# Altium project Vibration_Datalogger.PrjPcb (part 6 of 7)
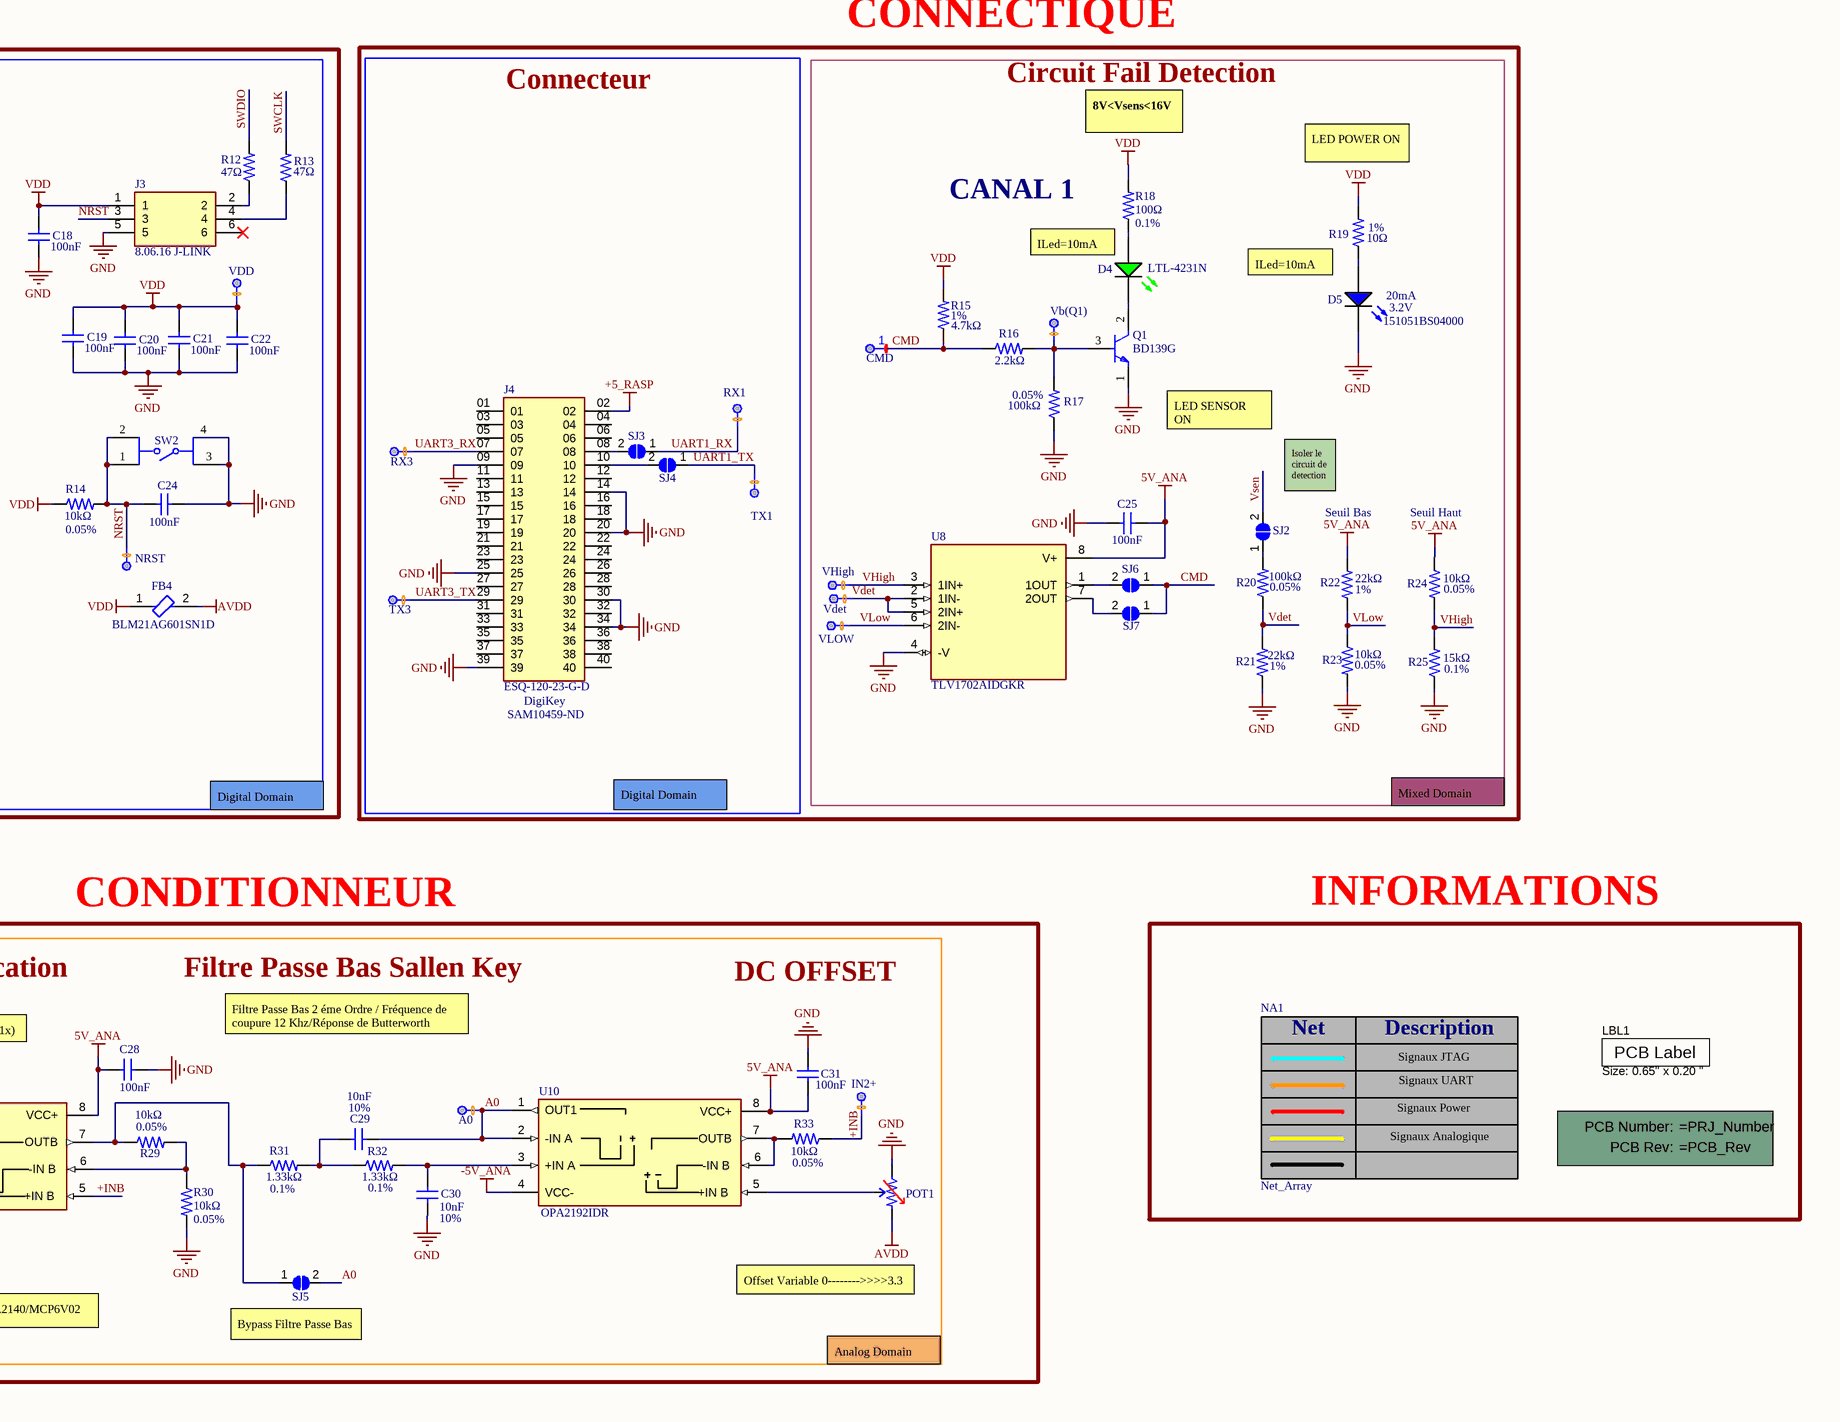
[diagram p8: Vibration_Datalogger_1.SchDoc, bottom right]

## Sheet Vibration_Datalogger_1.SchDoc: Title (continued)

### Library data of the parts (continued)
U1 = LM66100DCKR: IC OR CTRLR IDEAL DIODE SC70-6; Manufacturer Lifecycle Status: PRODUCTION; Manufacturer: Analog Devices; Manufacturer Part Number: MAX40200EVKIT#; Lifecycle Status: Production; Number of Pins: 0; ComponentLink1URL: https://octopart.com:443/opatz8j6/c1?t=tFvwJybQxdRSwHGuV29_04fkZjjNF1MJo4kinNSI_C2zYoGudT1WcQQrGEb18paZwrfXNr0GAhVW6zbilzcBUB01kDOundBfp3nAPKdGzhNRfNcr8Kd-o-IKbnLChbPI5acuj80HihnZ3YpglhuC93YoD2liOY8pIrKlWfxI2ksNeIXQmkzMRd3OxJBCHjiq5JwTIkqXKKJBcnIlnmQq-BxXXM0xZlJtTE9yy0iN-9Jw-BxLeaepZGVZeQukyGP-V4ddPgPOIL7y7GG0xbs0JlcCHvXn2V6R1aO10raT6v7tAmg4PF3dHGB7KA&src-supplier=Analog+Devices; ComponentLink1Description: https://octopart.com:443/opatz8j6/c1?t=tFvwJybQxdRSwHGuV29_04fkZjjNF1MJo4kinNSI_C2zYoGudT1WcQQrGEb18paZwrfXNr0GAhVW6zbilzcBUB01kDOundBfp3nAPKdGzhNRfNcr8Kd-o-IKbnLChbPI5acuj80HihnZ3YpglhuC93YoD2liOY8pIrKlWfxI2ksNeIXQmkzMRd3OxJBCHjiq5JwTIkqXKKJBcnIlnmQq-BxXXM0xZlJtTE9yy0iN-9Jw-BxLeaepZGVZeQukyGP-V4ddPgPOIL7y7GG0xbs0JlcCHvXn2V6R1aO10raT6v7tAmg4PF3dHGB7KA&src-supplier=Analog+Devices; ComponentLink2URL: https://datasheet.octopart.com:443/MAX40200EVKIT%23-Analog-Devices-datasheet-68620197.pdf?src-supplier=Newark; ComponentLink2Description: https://datasheet.octopart.com:443/MAX40200EVKIT%23-Analog-Devices-datasheet-68620197.pdf?src-supplier=Newark; ComponentLink3URL: https://datasheet.octopart.com:443/MAX40200EVKIT%23-Maxim-Integrated-datasheet-97040573.pdf?src-supplier=Ciiva; ComponentLink3Description: https://datasheet.octopart.com:443/MAX40200EVKIT%23-Maxim-Integrated-datasheet-97040573.pdf?src-supplier=Ciiva; ComponentLink4URL: http://sigma.octopart.com:80/conflict_mineral_statement/Analog-Devices-company-33.pdf?src-supplier=Compliance+Statements; ComponentLink4Description: http://sigma.octopart.com:80/conflict_mineral_statement/Analog-Devices-company-33.pdf?src-supplier=Compliance+Statements; ComponentLink5URL: http://sigma.octopart.com:80/reach_statement/Maxim-Integrated-company-67.pdf?src-supplier=Compliance+Statements; ComponentLink5Description: http://sigma.octopart.com:80/reach_statement/Maxim-Integrated-company-67.pdf?src-supplier=Compliance+Statements; ComponentLink6URL: http://sigma.octopart.com:80/rohs_statement/Maxim-Integrated-company-66.pdf?src-supplier=Compliance+Statements; ComponentLink6Description: http://sigma.octopart.com:80/rohs_statement/Maxim-Integrated-company-66.pdf?src-supplier=Compliance+Statements; ComponentLink7URL: http://sigma.octopart.com:80/conflict_mineral_statement/Maxim-Integrated-company-65.pdf?src-supplier=Compliance+Statements; ComponentLink7Description: http://sigma.octopart.com:80/conflict_mineral_statement/Maxim-Integrated-company-65.pdf?src-supplier=Compliance+Statements; ComponentLink8URL: https://octopart.com:443/opatz8j6/c1?t=lhYu1Dpa7LTUDRbSap38YS8RgdPNFucjyNBj1iBkH97VRV8Rz1sSJR_WbuGUEwASAToy64Q0WSWPLIrJ0T-nAuuegVbGWQDHKGX6zqZYr7BGDpqmoHu2Bx2I_9gTjHXC6Q3FVvsiWqfKxC4DKphXuDHYAktRAVkNYmR-AyWh8y_m0Ao45k5rUSJWIEdRU4kKjG7oew-8Zey8BXwpe1A7gxB-7jWBlaKfgfRJWbIXmBBGq6MNPZxkt7axoHwTDuLmHCNj-BNWr3LFNcmmigWLHCOy2qpNNTU7f_1GGqCMT2krBxkwy2j1AE6zAA&src-supplier=Compliance+Statements; ComponentLink8Description: https://octopart.com:443/opatz8j6/c1?t=lhYu1Dpa7LTUDRbSap38YS8RgdPNFucjyNBj1iBkH97VRV8Rz1sSJR_WbuGUEwASAToy64Q0WSWPLIrJ0T-nAuuegVbGWQDHKGX6zqZYr7BGDpqmoHu2Bx2I_9gTjHXC6Q3FVvsiWqfKxC4DKphXuDHYAktRAVkNYmR-AyWh8y_m0Ao45k5rUSJWIEdRU4kKjG7oew-8Zey8BXwpe1A7gxB-7jWBlaKfgfRJWbIXmBBGq6MNPZxkt7axoHwTDuLmHCNj-BNWr3LFNcmmigWLHCOy2qpNNTU7f_1GGqCMT2krBxkwy2j1AE6zAA&src-supplier=Compliance+Statements; Supplier 1: DigiKey; Supplier Part Number 1: MAX40200EVKIT#-ND; Category: Amplifiers - Op Amps, Buffer, Instrumentation; Height: 1.1mm; Length: 2mm; Schedule B: 8542390000, 8542390000|8542390000|8542390000|8542390000|8542390000; Thickness: 900µm; Width: 1.25mm; ComponentLink9URL: https://sigma.octopart.com:443/182282881/technical_drawing/Texas-Instruments-LM66100DCKR.pdf?src-supplier=Texas+Instruments; ComponentLink9Description: https://sigma.octopart.com:443/182282881/technical_drawing/Texas-Instruments-LM66100DCKR.pdf?src-supplier=Texas+Instruments; ComponentLink10URL: https://octopart.com:443/opatz8j6/c1?t=gPN0KfNaSyl1Jmpah-FtwEVBma6UUM1rl0h9fkGMVmOMkDkGAR5eANZSmXeULewPONOsdPcJF3l7HmsVxdSPKkJhfxN-W-y3_Dz8nEmVy4_KCMSg8IKJ1aK1b6dd_-lBB8AspW_E3SjYcpWMYk21piWnDxo2wj_olAEqlfdPT3wM4A0W15MhlRfy1F4koMZBOZ1iTSy3Fn5Q08Ie82jiMGpjle9KvlKTYKALn1cbScAkVWpjv40trNU2vz6I3zWF1hu3m4xMYxVIRa3xiN9pV6fBa2Lpcw1bs8mCpy-ETl7Wi3TV7TgH1BZJhC7NO3ryfYbwwTmsEcijnrG4LoteN3ANdJgPfKX2jeXCkaz5iFtb7oDgnzFTK08_BwgTfkX6eAf0F7jE&src-supplier=Texas+Instruments; ComponentLink10Description: https://octopart.com:443/opatz8j6/c1?t=gPN0KfNaSyl1Jmpah-FtwEVBma6UUM1rl0h9fkGMVmOMkDkGAR5eANZSmXeULewPONOsdPcJF3l7HmsVxdSPKkJhfxN-W-y3_Dz8nEmVy4_KCMSg8IKJ1aK1b6dd_-lBB8AspW_E3SjYcpWMYk21piWnDxo2wj_olAEqlfdPT3wM4A0W15MhlRfy1F4koMZBOZ1iTSy3Fn5Q08Ie82jiMGpjle9KvlKTYKALn1cbScAkVWpjv40trNU2vz6I3zWF1hu3m4xMYxVIRa3xiN9pV6fBa2Lpcw1bs8mCpy-ETl7Wi3TV7TgH1BZJhC7NO3ryfYbwwTmsEcijnrG4LoteN3ANdJgPfKX2jeXCkaz5iFtb7oDgnzFTK08_BwgTfkX6eAf0F7jE&src-supplier=Texas+Instruments; ComponentLink11URL: https://sigma.octopart.com:443/178868976/technical_drawing/Texas-Instruments-LM66100DCKR.pdf?src-supplier=Texas+Instruments; ComponentLink11Description: https://sigma.octopart.com:443/178868976/technical_drawing/Texas-Instruments-LM66100DCKR.pdf?src-supplier=Texas+Instruments; ComponentLink12URL: https://sigma.octopart.com:443/49249328/technical_drawing/Texas-Instruments-LM66100DCKR.pdf?src-supplier=Texas+Instruments; ComponentLink12Description: https://sigma.octopart.com:443/49249328/technical_drawing/Texas-Instruments-LM66100DCKR.pdf?src-supplier=Texas+Instruments; ComponentLink13URL: https://datasheet.octopart.com:443/LM66100DCKR-Texas-Instruments-datasheet-159115275.pdf?src-supplier=SHENGYU+ELECTRONICS; ComponentLink13Description: https://datasheet.octopart.com:443/LM66100DCKR-Texas-Instruments-datasheet-159115275.pdf?src-supplier=SHENGYU+ELECTRONICS; ComponentLink14URL: https://datasheet.octopart.com:443/LM66100DCKR-Texas-Instruments-datasheet-159115156.pdf?src-supplier=LCSC; ComponentLink14Description: https://datasheet.octopart.com:443/LM66100DCKR-Texas-Instruments-datasheet-159115156.pdf?src-supplier=LCSC; ComponentLink15URL: http://sigma.octopart.com:80/reach_statement/Texas-Instruments-company-64.pdf?src-supplier=Compliance+Statements; ComponentLink15Description: http://sigma.octopart.com:80/reach_statement/Texas-Instruments-company-64.pdf?src-supplier=Compliance+Statements; ComponentLink16URL: http://sigma.octopart.com:80/conflict_mineral_statement/Texas-Instruments-company-63.pdf?src-supplier=Compliance+Statements; ComponentLink16Description: http://sigma.octopart.com:80/conflict_mineral_statement/Texas-Instruments-company-63.pdf?src-supplier=Compliance+Statements; Supplier 2: DigiKey; Supplier Part Number 2: 296-53541-1-ND
U2 = TPS25961DRVR: 2.7-V TO 19-V 100-M EFUSE WITH O; Manufacturer Lifecycle Status: ACTIVE; Manufacturer: Texas Instruments; Height: 800µm; Length: 2mm; Lifecycle Status: Production; Number of Pins: 6; Thickness: 750µm; Width: 2mm; ComponentLink1URL: https://octopart.com:443/opatz8j6/c1?t=S1xkJqIgFHoRAs614Sh_f7mDPqY7n-9g1CVa4cNi5hxx6g81t8padSBjg378zsPx6m8IwrYaHi_RuHHS21coeVQCG3OxsLdcu6lzfAPU48-dyrvk4_ASk2QRBurpyuabN2jgAu76qrWKpaNbvEDSpOfD9CHua-RjlsRQwE5NGihYh6lU7KWDTs2xfTKoO0KOZB2pCRcjwk9NKxuG5vtAjT0Cx9vbluxsxBt5EiWrL8zHsz4VK5ehUOpKD3pUvdaCDW2TUYzUcGjzIwsfOe_OcwxBHByljdTQNEQqxSW97k3uNZ3rjtL21G73W6U59wTNDYHWdyWMBiSPwAoe43ZHRhsDoItLFKopzT7Ap-yvRHOtwgVqoKwa7xdY_lMZ9kctMjWSG-4I&src-supplier=Texas+Instruments; ComponentLink1Description: https://octopart.com:443/opatz8j6/c1?t=S1xkJqIgFHoRAs614Sh_f7mDPqY7n-9g1CVa4cNi5hxx6g81t8padSBjg378zsPx6m8IwrYaHi_RuHHS21coeVQCG3OxsLdcu6lzfAPU48-dyrvk4_ASk2QRBurpyuabN2jgAu76qrWKpaNbvEDSpOfD9CHua-RjlsRQwE5NGihYh6lU7KWDTs2xfTKoO0KOZB2pCRcjwk9NKxuG5vtAjT0Cx9vbluxsxBt5EiWrL8zHsz4VK5ehUOpKD3pUvdaCDW2TUYzUcGjzIwsfOe_OcwxBHByljdTQNEQqxSW97k3uNZ3rjtL21G73W6U59wTNDYHWdyWMBiSPwAoe43ZHRhsDoItLFKopzT7Ap-yvRHOtwgVqoKwa7xdY_lMZ9kctMjWSG-4I&src-supplier=Texas+Instruments; ComponentLink2URL: http://sigma.octopart.com:80/reach_statement/Texas-Instruments-company-64.pdf?src-supplier=Compliance+Statements; ComponentLink2Description: http://sigma.octopart.com:80/reach_statement/Texas-Instruments-company-64.pdf?src-supplier=Compliance+Statements; ComponentLink3URL: http://sigma.octopart.com:80/conflict_mineral_statement/Texas-Instruments-company-63.pdf?src-supplier=Compliance+Statements; ComponentLink3Description: http://sigma.octopart.com:80/conflict_mineral_statement/Texas-Instruments-company-63.pdf?src-supplier=Compliance+Statements; Supplier 1: DigiKey; Supplier Part Number 1: 296-TPS25961DRVRCT-ND; Category: Hot Swap Controllers; Manufacturer Part Number: TPS25961DRVR
U3 = TPS61041DBVR: IC LED DRVR RGLTR PWM SOT23-5; Manufacturer Lifecycle Status: ACTIVE; Efficiency: 85%; Frequency: 1MHz; High Level Output Current: 50mA; Max Input Voltage: 6V; Max Output Voltage: 28V; Max Supply Current: 50µA; Min Input Voltage: 1.8V; Number of Channels: 1; Output Current: 250mA; Output Power: 357mW; Output Type: Adjustable; Quiescent Current: 28µA; Topology: Boost; Case/Package: SOT-23; Height: 1.45mm; Lead Free: Lead Free; Length: 2.9mm; Lifecycle Status: Production; Max Operating Temperature: 85°C; Max Output Current: 50mA; Max Supply Voltage: 6V; Min Operating Temperature: -40°C; Min Output Voltage: 1.8V; Min Supply Voltage: 1.8V; Nominal Input Voltage: 6V; Number of Outputs: 1; Number of Pins: 5; Output Voltage: 28V; Packaging: Cut Tape; Radiation Hardening: No; REACH SVHC: No; Schedule B: 8542390000, 8542390000|8542390000|8542390000|8542390000|8542390000; Switching Frequency: 1MHz; Termination: SMD/SMT; Thickness: 1.2mm; Weight: 13.012431mg; Width: 1.6mm; ComponentLink1URL: https://sigma.octopart.com:443/177332311/technical_drawing/Texas-Instruments-TPS61041DBVR.pdf?src-supplier=Texas+Instruments; ComponentLink1Description: https://sigma.octopart.com:443/177332311/technical_drawing/Texas-Instruments-TPS61041DBVR.pdf?src-supplier=Texas+Instruments; ComponentLink2URL: https://octopart.com:443/opatz8j6/c1?t=k3wc_2YAHre9aEKvrtUL4WiH_7gyz5vvYIpgl3-_DoieH9_J--UOA_4swiipad8nwfdCqRPE7cAU4y7fXoWH5s6gY_OEZpDmt4BRm_vJuqCU6_G0QTbABtNIj9X3Wk4rNKXV0JPXgFqA4mKESAibKFXCpnwvyJyx-23z5q8y4uzBqg0JgwBOXenSBHlC9K7HJNs8eSKIWkGQ0JIBH81RxiwzCGA96NNC9jBkZo0lS8D4_ep_iqgTZ6YmA3U9-nDW1JxenI6HkSB-BibaSeiW2gkfclnyBbKiNZExXKpJZUM-3bb4z0zpDkNUz1E0CZwEhr9E5_3q7KKvBqOAVMCAxqghPF0D-78aDMoSTVOHvFhBGbArx7jxUefcD653syxCxtR4QA&src-supplier=Texas+Instruments; ComponentLink2Description: https://octopart.com:443/opatz8j6/c1?t=k3wc_2YAHre9aEKvrtUL4WiH_7gyz5vvYIpgl3-_DoieH9_J--UOA_4swiipad8nwfdCqRPE7cAU4y7fXoWH5s6gY_OEZpDmt4BRm_vJuqCU6_G0QTbABtNIj9X3Wk4rNKXV0JPXgFqA4mKESAibKFXCpnwvyJyx-23z5q8y4uzBqg0JgwBOXenSBHlC9K7HJNs8eSKIWkGQ0JIBH81RxiwzCGA96NNC9jBkZo0lS8D4_ep_iqgTZ6YmA3U9-nDW1JxenI6HkSB-BibaSeiW2gkfclnyBbKiNZExXKpJZUM-3bb4z0zpDkNUz1E0CZwEhr9E5_3q7KKvBqOAVMCAxqghPF0D-78aDMoSTVOHvFhBGbArx7jxUefcD653syxCxtR4QA&src-supplier=Texas+Instruments; ComponentLink3URL: https://datasheet.octopart.com:443/TPS61041DBVR-Texas-Instruments-datasheet-37140377.pdf?src-supplier=Texas+Instruments; ComponentLink3Description: https://datasheet.octopart.com:443/TPS61041DBVR-Texas-Instruments-datasheet-37140377.pdf?src-supplier=Texas+Instruments; ComponentLink4URL: https://sigma.octopart.com:443/175570406/technical_drawing/Texas-Instruments-TPS61041DBVR.pdf?src-supplier=Texas+Instruments; ComponentLink4Description: https://sigma.octopart.com:443/175570406/technical_drawing/Texas-Instruments-TPS61041DBVR.pdf?src-supplier=Texas+Instruments; ComponentLink5URL: https://sigma.octopart.com:443/169406034/technical_drawing/Texas-Instruments-TPS61041DBVR.pdf?src-supplier=Texas+Instruments; ComponentLink5Description: https://sigma.octopart.com:443/169406034/technical_drawing/Texas-Instruments-TPS61041DBVR.pdf?src-supplier=Texas+Instruments; ComponentLink6URL: https://sigma.octopart.com:443/155939316/technical_drawing/Texas-Instruments-TPS61041DBVR.pdf?src-supplier=Texas+Instruments; ComponentLink6Description: https://sigma.octopart.com:443/155939316/technical_drawing/Texas-Instruments-TPS61041DBVR.pdf?src-supplier=Texas+Instruments; ComponentLink7URL: https://sigma.octopart.com:443/102331370/technical_drawing/Texas-Instruments-TPS61041DBVR.pdf?src-supplier=Texas+Instruments; ComponentLink7Description: https://sigma.octopart.com:443/102331370/technical_drawing/Texas-Instruments-TPS61041DBVR.pdf?src-supplier=Texas+Instruments; ComponentLink8URL: https://datasheet.octopart.com:443/TPS61041DBVR-Texas-Instruments-datasheet-34157400.pdf?src-supplier=Texas+Instruments; ComponentLink8Description: https://datasheet.octopart.com:443/TPS61041DBVR-Texas-Instruments-datasheet-34157400.pdf?src-supplier=Texas+Instruments; ComponentLink9URL: https://sigma.octopart.com:443/49249325/technical_drawing/Texas-Instruments-TPS61041DBVR.pdf?src-supplier=Texas+Instruments; ComponentLink9Description: https://sigma.octopart.com:443/49249325/technical_drawing/Texas-Instruments-TPS61041DBVR.pdf?src-supplier=Texas+Instruments; ComponentLink10URL: https://datasheet.octopart.com:443/TPS61041DBVR-Texas-Instruments-datasheet-10256988.pdf?src-supplier=Texas+Instruments; ComponentLink10Description: https://datasheet.octopart.com:443/TPS61041DBVR-Texas-Instruments-datasheet-10256988.pdf?src-supplier=Texas+Instruments; ComponentLink11URL: https://datasheet.octopart.com:443/TPS61041DBVR-Texas-Instruments-datasheet-150964.pdf?src-supplier=Farnell; ComponentLink11Description: https://datasheet.octopart.com:443/TPS61041DBVR-Texas-Instruments-datasheet-150964.pdf?src-supplier=Farnell; ComponentLink12URL: https://datasheet.octopart.com:443/TPS61041DBVR-Texas-Instruments-datasheet-13549163.pdf?src-supplier=Upverter; ComponentLink12Description: https://datasheet.octopart.com:443/TPS61041DBVR-Texas-Instruments-datasheet-13549163.pdf?src-supplier=Upverter; ComponentLink13URL: https://datasheet.octopart.com:443/TPS61041DBVR-Texas-Instruments-datasheet-66617810.pdf?src-supplier=Newark; ComponentLink13Description: https://datasheet.octopart.com:443/TPS61041DBVR-Texas-Instruments-datasheet-66617810.pdf?src-supplier=Newark; ComponentLink14URL: https://datasheet.octopart.com:443/TPS61041DBVR-Texas-Instruments-datasheet-5394864.pdf?src-supplier=Newark; ComponentLink14Description: https://datasheet.octopart.com:443/TPS61041DBVR-Texas-Instruments-datasheet-5394864.pdf?src-supplier=Newark; ComponentLink15URL: https://datasheet.octopart.com:443/TPS61041DBVR-Texas-Instruments-datasheet-33019193.pdf?src-supplier=Newark; ComponentLink15Description: https://datasheet.octopart.com:443/TPS61041DBVR-Texas-Instruments-datasheet-33019193.pdf?src-supplier=Newark; ComponentLink16URL: https://datasheet.octopart.com:443/TPS61041DBVR-Texas-Instruments-datasheet-28738.pdf?src-supplier=Newark; ComponentLink16Description: https://datasheet.octopart.com:443/TPS61041DBVR-Texas-Instruments-datasheet-28738.pdf?src-supplier=Newark; ComponentLink17URL: https://datasheet.octopart.com:443/TPS61041DBVR-Texas-Instruments-datasheet-165804802.pdf?src-supplier=LCSC; ComponentLink17Description: https://datasheet.octopart.com:443/TPS61041DBVR-Texas-Instruments-datasheet-165804802.pdf?src-supplier=LCSC; ComponentLink18URL: https://datasheet.octopart.com:443/TPS61041DBVR-Texas-Instruments-datasheet-159118170.pdf?src-supplier=LCSC; ComponentLink18Description: https://datasheet.octopart.com:443/TPS61041DBVR-Texas-Instruments-datasheet-159118170.pdf?src-supplier=LCSC; ComponentLink19URL: https://datasheet.octopart.com:443/TPS61041DBVR-Texas-Instruments-datasheet-137316104.pdf?src-supplier=Future+Electronics; ComponentLink19Description: https://datasheet.octopart.com:443/TPS61041DBVR-Texas-Instruments-datasheet-137316104.pdf?src-supplier=Future+Electronics; ComponentLink20URL: https://datasheet.octopart.com:443/TPS61041DBVR-Texas-Instruments-datasheet-17023098.pdf?src-supplier=Factory+Futures; ComponentLink20Description: https://datasheet.octopart.com:443/TPS61041DBVR-Texas-Instruments-datasheet-17023098.pdf?src-supplier=Factory+Futures; ComponentLink21URL: https://datasheet.octopart.com:443/TPS61041DBVR-Texas-Instruments-datasheet-14155781.pdf?src-supplier=iiiC; ComponentLink21Description: https://datasheet.octopart.com:443/TPS61041DBVR-Texas-Instruments-datasheet-14155781.pdf?src-supplier=iiiC; ComponentLink22URL: https://datasheet.octopart.com:443/TPS61041DBVR-Texas-Instruments-datasheet-8716823.pdf?src-supplier=element14; ComponentLink22Description: https://datasheet.octopart.com:443/TPS61041DBVR-Texas-Instruments-datasheet-8716823.pdf?src-supplier=element14; ComponentLink23URL: https://datasheet.octopart.com:443/TPS61041DBVR-Texas-Instruments-datasheet-8444271.pdf?src-supplier=Jameco; ComponentLink23Description: https://datasheet.octopart.com:443/TPS61041DBVR-Texas-Instruments-datasheet-8444271.pdf?src-supplier=Jameco; ComponentLink24URL: https://datasheet.octopart.com:443/TPS61041DBVR-Texas-Instruments-datasheet-112971.pdf?src-supplier=Sierra+IC; ComponentLink24Description: https://datasheet.octopart.com:443/TPS61041DBVR-Texas-Instruments-datasheet-112971.pdf?src-supplier=Sierra+IC; ComponentLink25URL: https://datasheet.octopart.com:443/TPS61041DBVR-Texas-Instruments-datasheet-46314.pdf?src-supplier=DigiKey; ComponentLink25Description: https://datasheet.octopart.com:443/TPS61041DBVR-Texas-Instruments-datasheet-46314.pdf?src-supplier=DigiKey; ComponentLink26URL: http://sigma.octopart.com:80/reach_statement/Texas-Instruments-company-64.pdf?src-supplier=Compliance+Statements; ComponentLink26Description: http://sigma.octopart.com:80/reach_statement/Texas-Instruments-company-64.pdf?src-supplier=Compliance+Statements; ComponentLink27URL: http://sigma.octopart.com:80/conflict_mineral_statement/Texas-Instruments-company-63.pdf?src-supplier=Compliance+Statements; ComponentLink27Description: http://sigma.octopart.com:80/conflict_mineral_statement/Texas-Instruments-company-63.pdf?src-supplier=Compliance+Statements; Supplier 1: DigiKey; Supplier Part Number 1: 296-12686-6-ND
U4 = MAX660ESA+: IC REG CHRG PUMP INV 100MA 8SOIC; Manufacturer Lifecycle Status: PRODUCTION; Manufacturer: Analog Devices; Frequency: 80kHz; Max Power Dissipation: 471mW; Max Supply Voltage: 5.5V; Min Supply Voltage: 1.5V; Number of Outputs: 1; Output Type: Adjustable, Fixed; Output Voltage: -5.5V; Topology: Charge Pump; Height: 1.75mm; Lead Free: Lead Free; Lifecycle Status: Production; Max Operating Temperature: 85°C; Min Operating Temperature: -40°C; Number of Pins: 8; Output Current: 100mA; Packaging: Cut Tape; Schedule B: 8542390000|8542390000|8542390000|8542390000|8542390000|8542390000|8542390000|8542390000|8542390000|8542390000|8542390000|8542390000|8542390000|8542390000|8542390000|8542390000|8542390000|8542390000|8542390000|8542390000|8542390000|8542390000|8542390000|85; Switching Frequency: 80kHz; ComponentLink1URL: https://octopart.com:443/opatz8j6/c1?t=BWm-YoLOFKb6oTKA2-Oa4woj27f-4YlCw5RYG4XUvLKyF9jhqQp7CDL1R-jUfGSIj8ojPOaXqpXMzOVEXwzj2LU6GuUqVKy7rwppXb6Yhe4DcuX79IRSBrO0V0NOqZ5Kv--2xZ3GHk-ilmZIs_As33ZUjG3zZiE6Tsxk00EUgeO-VTdb5C75kIUUrUAAbuqL1eYBnEZWyx91WmaafFy1hHjUlVhFkCDvZPzEqQi0WpARzDPBuDggqnmZtUecc_6gAtnHDSZQU4AbmUeUFKfNs9EDVHME16KlOUrtC6ejHgeZa6J1DqKojKU&src-supplier=Analog+Devices; ComponentLink1Description: https://octopart.com:443/opatz8j6/c1?t=BWm-YoLOFKb6oTKA2-Oa4woj27f-4YlCw5RYG4XUvLKyF9jhqQp7CDL1R-jUfGSIj8ojPOaXqpXMzOVEXwzj2LU6GuUqVKy7rwppXb6Yhe4DcuX79IRSBrO0V0NOqZ5Kv--2xZ3GHk-ilmZIs_As33ZUjG3zZiE6Tsxk00EUgeO-VTdb5C75kIUUrUAAbuqL1eYBnEZWyx91WmaafFy1hHjUlVhFkCDvZPzEqQi0WpARzDPBuDggqnmZtUecc_6gAtnHDSZQU4AbmUeUFKfNs9EDVHME16KlOUrtC6ejHgeZa6J1DqKojKU&src-supplier=Analog+Devices; ComponentLink2URL: https://sigma.octopart.com:443/138896678/technical_drawing/Maxim-Integrated-MAX660ESA%2B.pdf?src-supplier=Upverter; ComponentLink2Description: https://sigma.octopart.com:443/138896678/technical_drawing/Maxim-Integrated-MAX660ESA%2B.pdf?src-supplier=Upverter; ComponentLink3URL: https://datasheet.octopart.com:443/MAX660ESA%2B-Analog-Devices-datasheet-88072.pdf?src-supplier=Augswan; ComponentLink3Description: https://datasheet.octopart.com:443/MAX660ESA%2B-Analog-Devices-datasheet-88072.pdf?src-supplier=Augswan; ComponentLink4URL: https://datasheet.octopart.com:443/MAX660ESA%2B-Maxim-Integrated-datasheet-14167743.pdf?src-supplier=iiiC; ComponentLink4Description: https://datasheet.octopart.com:443/MAX660ESA%2B-Maxim-Integrated-datasheet-14167743.pdf?src-supplier=iiiC; ComponentLink5URL: https://datasheet.octopart.com:443/MAX660ESA%2B-Maxim-datasheet-8202664.pdf?src-supplier=Jameco; ComponentLink5Description: https://datasheet.octopart.com:443/MAX660ESA%2B-Maxim-datasheet-8202664.pdf?src-supplier=Jameco; ComponentLink6URL: http://sigma.octopart.com:80/conflict_mineral_statement/Analog-Devices-company-33.pdf?src-supplier=Compliance+Statements; ComponentLink6Description: http://sigma.octopart.com:80/conflict_mineral_statement/Analog-Devices-company-33.pdf?src-supplier=Compliance+Statements; ComponentLink7URL: http://sigma.octopart.com:80/reach_statement/Maxim-Integrated-company-67.pdf?src-supplier=Compliance+Statements; ComponentLink7Description: http://sigma.octopart.com:80/reach_statement/Maxim-Integrated-company-67.pdf?src-supplier=Compliance+Statements; ComponentLink8URL: http://sigma.octopart.com:80/rohs_statement/Maxim-Integrated-company-66.pdf?src-supplier=Compliance+Statements; ComponentLink8Description: http://sigma.octopart.com:80/rohs_statement/Maxim-Integrated-company-66.pdf?src-supplier=Compliance+Statements; ComponentLink9URL: http://sigma.octopart.com:80/conflict_mineral_statement/Maxim-Integrated-company-65.pdf?src-supplier=Compliance+Statements; ComponentLink9Description: http://sigma.octopart.com:80/conflict_mineral_statement/Maxim-Integrated-company-65.pdf?src-supplier=Compliance+Statements; ComponentLink10URL: https://octopart.com:443/opatz8j6/c1?t=6seefSOhUnOhzho5f4xQzZxdMuzbyeX7e8GBP5GegPS5CIC4FLhGv9yyG7ITNmWqyiOeZamLNDV5KM8kLBPmWRpLipLEtqI0-UiQBhDpynsWuVJpY5DkYT-_WsnyYhRjHQRBGyfJu1WorA2bij2JhiLp4UPMZHCvQ6LWlYx2m7RLIqC0SmPcNbIfF0islbt2kir-QpHsqy3ruEwWWKir7ntLI5t72NWQmumO78YAP0BIbclvvZsZAIbyQ9oE_OmHW3VhlMLq6mYts_hLwHsHL5kN8P2U5bWrEFkUMOIg7-xCQI2zOd6uap0&src-supplier=Compliance+Statements; ComponentLink10Description: https://octopart.com:443/opatz8j6/c1?t=6seefSOhUnOhzho5f4xQzZxdMuzbyeX7e8GBP5GegPS5CIC4FLhGv9yyG7ITNmWqyiOeZamLNDV5KM8kLBPmWRpLipLEtqI0-UiQBhDpynsWuVJpY5DkYT-_WsnyYhRjHQRBGyfJu1WorA2bij2JhiLp4UPMZHCvQ6LWlYx2m7RLIqC0SmPcNbIfF0islbt2kir-QpHsqy3ruEwWWKir7ntLI5t72NWQmumO78YAP0BIbclvvZsZAIbyQ9oE_OmHW3VhlMLq6mYts_hLwHsHL5kN8P2U5bWrEFkUMOIg7-xCQI2zOd6uap0&src-supplier=Compliance+Statements; Supplier 1: DigiKey; Supplier Part Number 1: MAX660ESA+-ND; Category: Voltage Regulators - Switching; Manufacturer Part Number: MAX660ESA+
U5 = LM234Z-3/NOPB: Current Source, 3-Terminal Adjustable, True Temperature Sensor, Plastic TO-92; Manufacturer Lifecycle Status: ACTIVE; Accuracy: 3%; Element Configuration: Single; Forward Current: 10mA; Forward Voltage: 30V; Max Input Voltage: 40V; Min Input Voltage: 1V; Min Supply Voltage: 800mV; Number of Outputs: 1; Output Type: ANALOG; Tolerance: 1%; Case/Package: TO-92; Contact Plating: Tin; Height: 5.34mm; Length: 4.3mm; Lifecycle Status: Production; Max Operating Temperature: 100°C; Max Supply Voltage: 40V; Min Operating Temperature: -25°C; Mount: Through Hole; Number of Pins: 3; Output Current: 10mA; Packaging: Bulk; Radiation Hardening: No; REACH SVHC: No; Reference Type: Adjustable; Schedule B: 8542390000, 8542390000|8542390000|8542390000|8542390000|8542390000; Thickness: 3.6mm; Weight: 113.398093g; Width: 4.3mm; ComponentLink1URL: https://sigma.octopart.com:443/186639543/technical_drawing/Texas-Instruments-LM234Z-3-NOPB.pdf?src-supplier=Texas+Instruments; ComponentLink1Description: https://sigma.octopart.com:443/186639543/technical_drawing/Texas-Instruments-LM234Z-3-NOPB.pdf?src-supplier=Texas+Instruments; ComponentLink2URL: https://octopart.com:443/opatz8j6/c1?t=e2RhRCzYr4BaemLKaI6Kyl3dLkHRe8cPAR4nziHvLPZ6u3jocPbqPLczMX_qB1TjFc-rJuwH_w-1wo1QGmPhsZ1mqhfKdPD5jpPqpl7yftw6J2g7-DTlU3_2G7dKSwHwSh6eukuUpBIPfNV1XT-9p1oyGC5G5eJiZKdnpuoPpf5EaSVhUsFdMRU3maN4bF8ozYEKU_jysdVImzqDi1TDLCJdrref1n5n5_0vXDw3MPju_9xOun07LLv6P4X42jtso8hs6KAV3GADMlBCLxlwsMx1u6oXZTSS6Wxl3egRpprv4mlbr_xSjL6X3a2EknwEBnBODLJqNHpw2tFUkmIOCRVZvCq3Oa3d8Eedi_f1nUyBT_fc1nqfr2u4_9z82xhjLH8&src-supplier=Texas+Instruments; ComponentLink2Description: https://octopart.com:443/opatz8j6/c1?t=e2RhRCzYr4BaemLKaI6Kyl3dLkHRe8cPAR4nziHvLPZ6u3jocPbqPLczMX_qB1TjFc-rJuwH_w-1wo1QGmPhsZ1mqhfKdPD5jpPqpl7yftw6J2g7-DTlU3_2G7dKSwHwSh6eukuUpBIPfNV1XT-9p1oyGC5G5eJiZKdnpuoPpf5EaSVhUsFdMRU3maN4bF8ozYEKU_jysdVImzqDi1TDLCJdrref1n5n5_0vXDw3MPju_9xOun07LLv6P4X42jtso8hs6KAV3GADMlBCLxlwsMx1u6oXZTSS6Wxl3egRpprv4mlbr_xSjL6X3a2EknwEBnBODLJqNHpw2tFUkmIOCRVZvCq3Oa3d8Eedi_f1nUyBT_fc1nqfr2u4_9z82xhjLH8&src-supplier=Texas+Instruments; ComponentLink3URL: https://datasheet.octopart.com:443/LM234Z-3-NOPB-Texas-Instruments-datasheet-37129293.pdf?src-supplier=Texas+Instruments; ComponentLink3Description: https://datasheet.octopart.com:443/LM234Z-3-NOPB-Texas-Instruments-datasheet-37129293.pdf?src-supplier=Texas+Instruments; ComponentLink4URL: https://sigma.octopart.com:443/81678662/technical_drawing/Texas-Instruments-LM234Z-3-NOPB.pdf?src-supplier=Texas+Instruments; ComponentLink4Description: https://sigma.octopart.com:443/81678662/technical_drawing/Texas-Instruments-LM234Z-3-NOPB.pdf?src-supplier=Texas+Instruments; ComponentLink5URL: https://sigma.octopart.com:443/49250678/technical_drawing/Texas-Instruments-LM234Z-3-NOPB.pdf?src-supplier=Texas+Instruments; ComponentLink5Description: https://sigma.octopart.com:443/49250678/technical_drawing/Texas-Instruments-LM234Z-3-NOPB.pdf?src-supplier=Texas+Instruments; ComponentLink6URL: https://datasheet.octopart.com:443/LM234Z-3-NOPB-Texas-Instruments-datasheet-15827902.pdf?src-supplier=Texas+Instruments; ComponentLink6Description: https://datasheet.octopart.com:443/LM234Z-3-NOPB-Texas-Instruments-datasheet-15827902.pdf?src-supplier=Texas+Instruments; ComponentLink7URL: https://datasheet.octopart.com:443/LM234Z-3-NOPB-Texas-Instruments-datasheet-15031981.pdf?src-supplier=Texas+Instruments; ComponentLink7Description: https://datasheet.octopart.com:443/LM234Z-3-NOPB-Texas-Instruments-datasheet-15031981.pdf?src-supplier=Texas+Instruments; ComponentLink8URL: https://datasheet.octopart.com:443/LM234Z-3/NOPB-Texas-Instruments-datasheet-10669237.pdf?src-supplier=Verical; ComponentLink8Description: https://datasheet.octopart.com:443/LM234Z-3/NOPB-Texas-Instruments-datasheet-10669237.pdf?src-supplier=Verical; ComponentLink9URL: https://datasheet.octopart.com:443/LM234Z-3/NOPB-National-Semiconductor-datasheet-31214.pdf?src-supplier=Future+Electronics; ComponentLink9Description: https://datasheet.octopart.com:443/LM234Z-3/NOPB-National-Semiconductor-datasheet-31214.pdf?src-supplier=Future+Electronics; ComponentLink10URL: https://datasheet.octopart.com:443/LM234Z-3-NOPB-Texas-Instruments-datasheet-65712963.pdf?src-supplier=Newark; ComponentLink10Description: https://datasheet.octopart.com:443/LM234Z-3-NOPB-Texas-Instruments-datasheet-65712963.pdf?src-supplier=Newark; ComponentLink11URL: https://datasheet.octopart.com:443/LM234Z-3-NOPB-Texas-Instruments-datasheet-32045309.pdf?src-supplier=Newark; ComponentLink11Description: https://datasheet.octopart.com:443/LM234Z-3-NOPB-Texas-Instruments-datasheet-32045309.pdf?src-supplier=Newark; ComponentLink12URL: https://datasheet.octopart.com:443/LM234Z-3-NOPB-Texas-Instruments-datasheet-27908155.pdf?src-supplier=Farnell; ComponentLink12Description: https://datasheet.octopart.com:443/LM234Z-3-NOPB-Texas-Instruments-datasheet-27908155.pdf?src-supplier=Farnell; ComponentLink13URL: https://datasheet.octopart.com:443/LM234Z-3-NOPB-Texas-Instruments-datasheet-26823820.pdf?src-supplier=Farnell; ComponentLink13Description: https://datasheet.octopart.com:443/LM234Z-3-NOPB-Texas-Instruments-datasheet-26823820.pdf?src-supplier=Farnell; ComponentLink14URL: https://datasheet.octopart.com:443/LM234Z-3-NOPB-Texas-Instruments-datasheet-20860903.pdf?src-supplier=element14+APAC; ComponentLink14Description: https://datasheet.octopart.com:443/LM234Z-3-NOPB-Texas-Instruments-datasheet-20860903.pdf?src-supplier=element14+APAC; ComponentLink15URL: https://datasheet.octopart.com:443/LM234Z-3-NOPB-Texas-Instruments-datasheet-159115105.pdf?src-supplier=SHENGYU+ELECTRONICS; ComponentLink15Description: https://datasheet.octopart.com:443/LM234Z-3-NOPB-Texas-Instruments-datasheet-159115105.pdf?src-supplier=SHENGYU+ELECTRONICS; ComponentLink16URL: https://datasheet.octopart.com:443/LM234Z-3-NOPB-Texas-Instruments-datasheet-83038145.pdf?src-supplier=TME; ComponentLink16Description: https://datasheet.octopart.com:443/LM234Z-3-NOPB-Texas-Instruments-datasheet-83038145.pdf?src-supplier=TME; ComponentLink17URL: https://datasheet.octopart.com:443/LM234Z-3-NOPB-Texas-Instruments-datasheet-16809449.pdf?src-supplier=TME; ComponentLink17Description: https://datasheet.octopart.com:443/LM234Z-3-NOPB-Texas-Instruments-datasheet-16809449.pdf?src-supplier=TME; ComponentLink18URL: https://datasheet.octopart.com:443/LM234Z-3/NOPB-National-Semiconductor-datasheet-9767840.pdf?src-supplier=RS+(Formerly+Allied+Electronics); ComponentLink18Description: https://datasheet.octopart.com:443/LM234Z-3/NOPB-National-Semiconductor-datasheet-9767840.pdf?src-supplier=RS+(Formerly+Allied+Electronics); ComponentLink19URL: https://datasheet.octopart.com:443/LM234Z-3-NOPB-Texas-Instruments-datasheet-8200682.pdf?src-supplier=Jameco; ComponentLink19Description: https://datasheet.octopart.com:443/LM234Z-3-NOPB-Texas-Instruments-datasheet-8200682.pdf?src-supplier=Jameco; ComponentLink20URL: http://sigma.octopart.com:80/reach_statement/Texas-Instruments-company-64.pdf?src-supplier=Compliance+Statements; ComponentLink20Description: http://sigma.octopart.com:80/reach_statement/Texas-Instruments-company-64.pdf?src-supplier=Compliance+Statements; ComponentLink21URL: http://sigma.octopart.com:80/conflict_mineral_statement/Texas-Instruments-company-63.pdf?src-supplier=Compliance+Statements; ComponentLink21Description: http://sigma.octopart.com:80/conflict_mineral_statement/Texas-Instruments-company-63.pdf?src-supplier=Compliance+Statements; Supplier 1: DigiKey; Supplier Part Number 1: LM234Z-3/NOPB-ND
U6 = TPS7B8233QWDRVRQ1: Automotive 300-mA, off-battery (40-V); Manufacturer Lifecycle Status: ACTIVE; Height: 800µm; Length: 2mm; Lifecycle Status: Production; Number of Pins: 6; Thickness: 750µm; Width: 2mm; ComponentLink1URL: https://octopart.com:443/opatz8j6/c1?t=7WSiqJunUI9PIgH4jquUaBZ0plxXeUuqYMIPiF3Fcq2ByK__oXuosoh3mTagRzsU4agXS4_UEROCi43alXdyG2a5hYo9-HG_-7X6kM4r6qj9wp7KdzS2C1Vmd9Ir5QWmeBQS-5NT3OlSg48qqFkngutyYdPK2ycNM9N52tSI-HUKm2h_zSeQewzbAIKyX1a4E_EF_w0K0VgOFf-574NeTyVLxAkzIKiRGI-2MsPoZkbg6c0ISr3inrqLNKDuytzNxSijH2pgjYuFKlNzqyrZ4zZhF9z6BiGuo0zDncjw1a8TyHWSFf_A30hHC09PYNw30vrLfKP2-2k4ZPSiKQLAJsQn9K0t10BVvaBPy7E6j06zM4Lupep1NpchOOxXVFjw1iOiQ3VzQ5l2&src-supplier=Texas+Instruments; ComponentLink1Description: https://octopart.com:443/opatz8j6/c1?t=7WSiqJunUI9PIgH4jquUaBZ0plxXeUuqYMIPiF3Fcq2ByK__oXuosoh3mTagRzsU4agXS4_UEROCi43alXdyG2a5hYo9-HG_-7X6kM4r6qj9wp7KdzS2C1Vmd9Ir5QWmeBQS-5NT3OlSg48qqFkngutyYdPK2ycNM9N52tSI-HUKm2h_zSeQewzbAIKyX1a4E_EF_w0K0VgOFf-574NeTyVLxAkzIKiRGI-2MsPoZkbg6c0ISr3inrqLNKDuytzNxSijH2pgjYuFKlNzqyrZ4zZhF9z6BiGuo0zDncjw1a8TyHWSFf_A30hHC09PYNw30vrLfKP2-2k4ZPSiKQLAJsQn9K0t10BVvaBPy7E6j06zM4Lupep1NpchOOxXVFjw1iOiQ3VzQ5l2&src-supplier=Texas+Instruments; ComponentLink2URL: http://sigma.octopart.com:80/reach_statement/Texas-Instruments-company-64.pdf?src-supplier=Compliance+Statements; ComponentLink2Description: http://sigma.octopart.com:80/reach_statement/Texas-Instruments-company-64.pdf?src-supplier=Compliance+Statements; ComponentLink3URL: http://sigma.octopart.com:80/conflict_mineral_statement/Texas-Instruments-company-63.pdf?src-supplier=Compliance+Statements; ComponentLink3Description: http://sigma.octopart.com:80/conflict_mineral_statement/Texas-Instruments-company-63.pdf?src-supplier=Compliance+Statements
U7 = STM32F303RET6: IC MCU 32BIT 512KB FLASH 64LQFP; Manufacturer: STMicroelectronics; ADC Channels (Resolution): 22-Ch 12-Bit; Core Architecture: ARM Cortex-M4; DAC Channels (Resolution): 2-Ch 12-Bit; Data Bus Width: 32b; EEPROM Memory Size: 0B; Frequency: 72MHz; Interface: CAN, IrDA, LIN, SMBus, USB; Max Frequency: 32MHz; Max Junction Temperature (Tj): 105°C; Max Supply Current: 76.9mA; Max Supply Voltage: 3.6V; Min Supply Voltage: 2V; Nominal Supply Current: 2µA; Number of A/D Converters: 4; Number of ADC Channels: 22; Number of D/A Converters: 2; Number of I2C Channels: 3; Number of I/Os: 51; Number of PWM Channels: 31; Number of Timers/Counters: 1; Operating Supply Voltage: 3.3V; Oscillator Type: Internal; Peripherals: POR; RAM Size: 64kB; Ambient Temperature Range High: 85°C; Case/Package: LFQFP; China RoHS: Compliant; Country of Origin: Mainland China; Export Control Classification Number (ECCN) Code: 3A991.A.2; Flash Memory Size: 512kB; Height: 1.6mm; Height - Seated (Max): 1.6mm; Harmonized Tariff Schedule (HTS) Code: 8542.31.00.25; Introduction Date: 2015-03-03; Lead Free: Lead Free; Length: 10mm; Lifecycle Status: Production; Max Operating Temperature: 85°C; Memory Size: 512kB; Memory Type: FLASH; Min Operating Temperature: -40°C; Mount: Surface Mount; Number of Channels: 22; Number of Pins: 64; Number of SPI Channels: 3; Number of Terminals: 64; Number of UART Channels: 2; Number of USART Channels: 3; Number of USB Channels: 1; REACH SVHC: Yes; Schedule B: 8542310000; Temperature Grade: Industrial; Terminal Pitch: 500µm; Weight: 342.689036mg; Width: 10mm; ComponentLink1URL: https://datasheet.octopart.com:443/STM32F303RET6-STMicroelectronics-datasheet-68303033.pdf?src-supplier=IHS; ComponentLink1Description: https://datasheet.octopart.com:443/STM32F303RET6-STMicroelectronics-datasheet-68303033.pdf?src-supplier=IHS; ComponentLink2URL: https://datasheet.octopart.com:443/STM32F303RET6-STMicroelectronics-datasheet-61689937.pdf?src-supplier=STMicroelectronics; ComponentLink2Description: https://datasheet.octopart.com:443/STM32F303RET6-STMicroelectronics-datasheet-61689937.pdf?src-supplier=STMicroelectronics; ComponentLink3URL: https://datasheet.octopart.com:443/STM32F303RET6-STMicroelectronics-datasheet-37090231.pdf?src-supplier=STMicroelectronics; ComponentLink3Description: https://datasheet.octopart.com:443/STM32F303RET6-STMicroelectronics-datasheet-37090231.pdf?src-supplier=STMicroelectronics; ComponentLink4URL: https://datasheet.octopart.com:443/STM32F303RET6-STMicroelectronics-datasheet-43912984.pdf?src-supplier=element14+APAC; ComponentLink4Description: https://datasheet.octopart.com:443/STM32F303RET6-STMicroelectronics-datasheet-43912984.pdf?src-supplier=element14+APAC; ComponentLink5URL: https://datasheet.octopart.com:443/STM32F303RET6-STMicroelectronics-datasheet-37697013.pdf?src-supplier=Newark; ComponentLink5Description: https://datasheet.octopart.com:443/STM32F303RET6-STMicroelectronics-datasheet-37697013.pdf?src-supplier=Newark; ComponentLink6URL: https://datasheet.octopart.com:443/STM32F303RET6-STMicroelectronics-datasheet-37143350.pdf?src-supplier=Farnell; ComponentLink6Description: https://datasheet.octopart.com:443/STM32F303RET6-STMicroelectronics-datasheet-37143350.pdf?src-supplier=Farnell; ComponentLink7URL: https://datasheet.octopart.com:443/STM32F303RET6-STMicroelectronics-datasheet-136987017.pdf?src-supplier=TME; ComponentLink7Description: https://datasheet.octopart.com:443/STM32F303RET6-STMicroelectronics-datasheet-136987017.pdf?src-supplier=TME; Manufacturer Part Number: STM32F303RET6; Category: Microcontrollers; Supplier 1: DigiKey; Supplier Part Number 1: 497-15163-ND; Nominal Supply Voltage (DC): 3.3V
U8 = TLV1702AIDGKR: Dual high voltage, low power comparator 8-VSSOP -40 to 125; Manufacturer Lifecycle Status: ACTIVE; Manufacturer: Texas Instruments; Input Bias Current: 5nA; Input Offset Voltage (Vos): 500µV; Max Dual Supply Voltage: 18V; Max Input Current: 15nA; Max Junction Temperature (Tj): 150°C; Max Supply Voltage: 36V; Min Dual Supply Voltage: 1.1V; Min Supply Voltage: 2.2V; Nominal Supply Current: 55µA; Number of Channels: 2; Output Current: 20mA; Power Supply Rejection Ratio (PSRR): -96.48dB; Propagation Delay: 560ns; Quiescent Current: 75µA; Response Time: 780ns; Case/Package: VSSOP; Contact Plating: Gold, Silver; Height: 0m; Lead Free: Lead Free; Length: 3mm; Lifecycle Status: Production; Max Operating Temperature: 125°C; Min Operating Temperature: -40°C; Mount: Surface Mount; Number of Elements: 2; Number of Pins: 8; REACH SVHC: No; Schedule B: 8542390000, 8542390000|8542390000|8542390000|8542390000|8542390000|8542390000|8542390000|8542390000|8542390000|8542390000|8542390000|8542390000|8542390000|8542390000|8542390000|8542390000|8542390000|8542390000|8542390000|8542390000|8542390000|8542390000|8542390000|85; Thickness: 970µm; Type: General Purpose; Width: 3mm; ComponentLink1URL: https://sigma.octopart.com:443/178522223/technical_drawing/Texas-Instruments-TLV1702AIDGKR.pdf?src-supplier=Texas+Instruments; ComponentLink1Description: https://sigma.octopart.com:443/178522223/technical_drawing/Texas-Instruments-TLV1702AIDGKR.pdf?src-supplier=Texas+Instruments; ComponentLink2URL: https://octopart.com:443/opatz8j6/c1?t=iUaDZ-roroNCIkqhQWv481ZQhiF8nH3-hn0LhaP1ZkZhWb0ADq8d21KKoeXJAMhbDkTgPtXMcxPelJe7xmMcY3d8WOArPCvBD_CUDe98PeZzwIcJTAEO9QVrhY-wSCJLAyyKxEq_36_Jt6W9QKfV9tz-7JohwOIdPAcSF3qzmsqi29B08OhjiuU5AfCzN1A5u4SaLfV4xJOvorKTzgC3yuPazlCMruIP3GdvfBkPZKAH6DndcCKd1cwEkO599W7mIbsDlu8FlknlULDCKD5i6KonTEJfSLepJHYEgx4vVHjyxHkPkY-yJx7bnKvsyxO69ltH3DeBKHoo2qdhi6O-3z2GBnwoXNw5nBGCkfBeUnjnVFnxqD0vAPUpFnV2UOdJtoDqpNs&src-supplier=Texas+Instruments; ComponentLink2Description: https://octopart.com:443/opatz8j6/c1?t=iUaDZ-roroNCIkqhQWv481ZQhiF8nH3-hn0LhaP1ZkZhWb0ADq8d21KKoeXJAMhbDkTgPtXMcxPelJe7xmMcY3d8WOArPCvBD_CUDe98PeZzwIcJTAEO9QVrhY-wSCJLAyyKxEq_36_Jt6W9QKfV9tz-7JohwOIdPAcSF3qzmsqi29B08OhjiuU5AfCzN1A5u4SaLfV4xJOvorKTzgC3yuPazlCMruIP3GdvfBkPZKAH6DndcCKd1cwEkO599W7mIbsDlu8FlknlULDCKD5i6KonTEJfSLepJHYEgx4vVHjyxHkPkY-yJx7bnKvsyxO69ltH3DeBKHoo2qdhi6O-3z2GBnwoXNw5nBGCkfBeUnjnVFnxqD0vAPUpFnV2UOdJtoDqpNs&src-supplier=Texas+Instruments; ComponentLink3URL: https://datasheet.octopart.com:443/TLV1702AIDGKR-Texas-Instruments-datasheet-41217926.pdf?src-supplier=Texas+Instruments; ComponentLink3Description: https://datasheet.octopart.com:443/TLV1702AIDGKR-Texas-Instruments-datasheet-41217926.pdf?src-supplier=Texas+Instruments; ComponentLink4URL: https://datasheet.octopart.com:443/TLV1702AIDGKR-Texas-Instruments-datasheet-34154349.pdf?src-supplier=Texas+Instruments; ComponentLink4Description: https://datasheet.octopart.com:443/TLV1702AIDGKR-Texas-Instruments-datasheet-34154349.pdf?src-supplier=Texas+Instruments; ComponentLink5URL: https://datasheet.octopart.com:443/TLV1702AIDGKR-Texas-Instruments-datasheet-32736893.pdf?src-supplier=Texas+Instruments; ComponentLink5Description: https://datasheet.octopart.com:443/TLV1702AIDGKR-Texas-Instruments-datasheet-32736893.pdf?src-supplier=Texas+Instruments; ComponentLink6URL: https://datasheet.octopart.com:443/TLV1702AIDGKR-Texas-Instruments-datasheet-32015743.pdf?src-supplier=Texas+Instruments; ComponentLink6Description: https://datasheet.octopart.com:443/TLV1702AIDGKR-Texas-Instruments-datasheet-32015743.pdf?src-supplier=Texas+Instruments; ComponentLink7URL: https://datasheet.octopart.com:443/TLV1702AIDGKR-Texas-Instruments-datasheet-21256581.pdf?src-supplier=Texas+Instruments; ComponentLink7Description: https://datasheet.octopart.com:443/TLV1702AIDGKR-Texas-Instruments-datasheet-21256581.pdf?src-supplier=Texas+Instruments; ComponentLink8URL: https://sigma.octopart.com:443/49250154/technical_drawing/Texas-Instruments-TLV1702AIDGKR.pdf?src-supplier=Texas+Instruments; ComponentLink8Description: https://sigma.octopart.com:443/49250154/technical_drawing/Texas-Instruments-TLV1702AIDGKR.pdf?src-supplier=Texas+Instruments; ComponentLink9URL: https://datasheet.octopart.com:443/TLV1702AIDGKR-Texas-Instruments-datasheet-147835657.pdf?src-supplier=Upverter; ComponentLink9Description: https://datasheet.octopart.com:443/TLV1702AIDGKR-Texas-Instruments-datasheet-147835657.pdf?src-supplier=Upverter; ComponentLink10URL: https://datasheet.octopart.com:443/TLV1702AIDGKR-Texas-Instruments-datasheet-66581735.pdf?src-supplier=Newark; ComponentLink10Description: https://datasheet.octopart.com:443/TLV1702AIDGKR-Texas-Instruments-datasheet-66581735.pdf?src-supplier=Newark; ComponentLink11URL: https://datasheet.octopart.com:443/TLV1702AIDGKR-Texas-Instruments-datasheet-33012491.pdf?src-supplier=Newark; ComponentLink11Description: https://datasheet.octopart.com:443/TLV1702AIDGKR-Texas-Instruments-datasheet-33012491.pdf?src-supplier=Newark; ComponentLink12URL: https://datasheet.octopart.com:443/TLV1702AIDGKR-Texas-Instruments-datasheet-49588982.pdf?src-supplier=element14+APAC; ComponentLink12Description: https://datasheet.octopart.com:443/TLV1702AIDGKR-Texas-Instruments-datasheet-49588982.pdf?src-supplier=element14+APAC; ComponentLink13URL: https://datasheet.octopart.com:443/TLV1702AIDGKR-Texas-Instruments-datasheet-37140355.pdf?src-supplier=element14+APAC; ComponentLink13Description: https://datasheet.octopart.com:443/TLV1702AIDGKR-Texas-Instruments-datasheet-37140355.pdf?src-supplier=element14+APAC; ComponentLink14URL: https://datasheet.octopart.com:443/TLV1702AIDGKR-Texas-Instruments-datasheet-140571703.pdf?src-supplier=Arrow.cn; ComponentLink14Description: https://datasheet.octopart.com:443/TLV1702AIDGKR-Texas-Instruments-datasheet-140571703.pdf?src-supplier=Arrow.cn; ComponentLink15URL: https://datasheet.octopart.com:443/TLV1702AIDGKR-Texas-Instruments-datasheet-83188854.pdf?src-supplier=TME; ComponentLink15Description: https://datasheet.octopart.com:443/TLV1702AIDGKR-Texas-Instruments-datasheet-83188854.pdf?src-supplier=TME; ComponentLink16URL: http://sigma.octopart.com:80/reach_statement/Texas-Instruments-company-64.pdf?src-supplier=Compliance+Statements; ComponentLink16Description: http://sigma.octopart.com:80/reach_statement/Texas-Instruments-company-64.pdf?src-supplier=Compliance+Statements; ComponentLink17URL: http://sigma.octopart.com:80/conflict_mineral_statement/Texas-Instruments-company-63.pdf?src-supplier=Compliance+Statements; ComponentLink17Description: http://sigma.octopart.com:80/conflict_mineral_statement/Texas-Instruments-company-63.pdf?src-supplier=Compliance+Statements; Manufacturer Part Number: TLV1702AIDGKR; Category: Amplifiers - Op Amps, Buffer, Instrumentation; Supplier 1: DigiKey; Supplier Part Number 1: 296-37236-1-ND